# Altium schematic sheet HPF(20Hz).SchDoc
size A; SheetNumber: 5; SheetTotal: 7
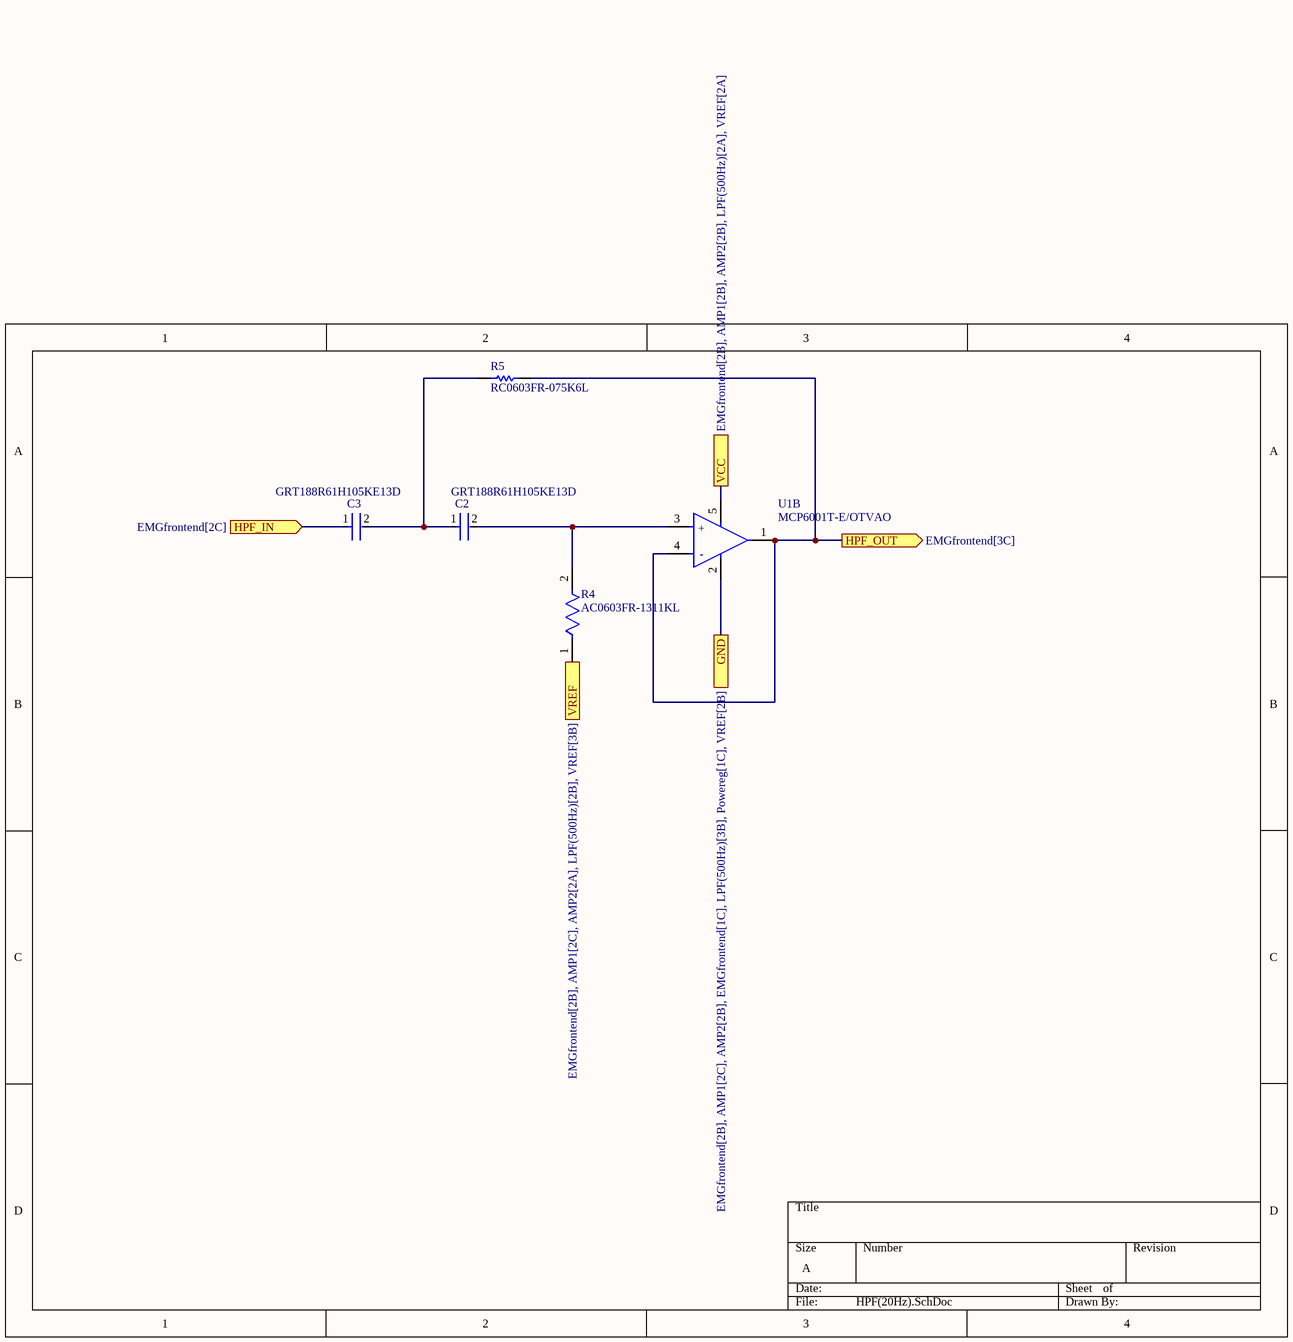
[diagram p0: HPF(20Hz).SchDoc]

## Parts
C2  GRT188R61H105KE13D  [FP-GRT188-0_1-e0_2_0_5-IPC_B]
C3  GRT188R61H105KE13D  [FP-GRT188-0_1-e0_2_0_5-IPC_B]
R4  AC0603FR-1311KL  [FP-AC0603-IPC_B]
R5  RC0603FR-075K6L  [RESC1608X55X25ML10T15]
U1B  MCP6001T-E/OTVAO  [FP-C04-091-OT-MFG]

## Ports
GND (see EMGfrontend[2B], AMP1[2C], AMP2[2B], EMGfrontend[1C], LPF(500Hz)[3B], Powereg[1C], VREF[2B]), HPF_IN (in, see EMGfrontend[2C]), HPF_OUT (out, see EMGfrontend[3C]), VCC (see EMGfrontend[2B], AMP1[2B], AMP2[2B], LPF(500Hz)[2A], VREF[2A]), VREF (in, see EMGfrontend[2B], AMP1[2C], AMP2[2A], LPF(500Hz)[2B], VREF[3B])

## Nets
GND: U1B.2(VSS) ; port GND
HPF_IN: C3.1 ; port HPF_IN
HPF_OUT: R5.2 U1B.1(VOUT) U1B.4(VIN-) ; port HPF_OUT
VCC: U1B.5(VDD) ; port VCC
VREF: R4.1 ; port VREF
NetC2_1: C2.1 C3.2 R5.1
NetC2_2: C2.2 R4.2 U1B.3(VIN+)

## Notes on the sheet
- (in symbol CMP-06302-000184-2) +; -

## Library data of the parts
C2 C3 = CMP-06035-031856-1: Multi-Layer Ceramic Capacitor 1uF 50V X5R ±10% 0603 Paper T/R; Voltage Rating (DC): 50V; Voltage Rating: 50V; Min Operating Temperature: -55°C; Case Code (Metric): 1608; Thickness: 0.035inch; Width: 0.031inch; Capacitance: 1uF; Tolerance: 10%; Max Operating Temperature: 85°C; Dielectric: X5R; Case Code (Imperial): 0603; Case/Package: 0603; Length: 0.063inch; Packaging: Tape and Reel; Mount: Surface Mount; Ratings: AEC-Q200
R4 = CMP-03412-047641-1: RES 11KΩ 1.00% 0.1W 0603; RoHS Compliant: Yes
R5 = CMP-1012-00595-2: Chip Resistor, 5.6 KOhm, +/- 1%, 0.1 W, -55 to 155 degC, 0603 (1608 Metric), RoHS, Tape and Reel; Voltage Rating: 50 V; Case\Package: 0603; Power Rating: 100 mW; Type (Resistor): Thick Film; Resistance: 332 kohm; ComponentLink1Description: Manufacturer URL; Case Code (Metric): 1608; Height: 0.45 mm; Min Operating Temperature: -55 degC; RoHSCompliant: true; ComponentLink2URL: http://www.yageo.com/documents/recent/PYu-RC_Group_51_RoHS_L_04.pdf; Length: 1.6 mm; ComponentLink2Description: Datasheet; Width: 0.8 mm; PackageReference: 0603; DatasheetVersion: Rev. 4, 02/2016; Package Quantity: 5000; Tolerance: 1%; Case Code (Imperial): 0603; PackageDescription: 2-Pin Surface Mount Device, Body 1.6 x 0.8 mm; ComponentLink1URL: http://www.yageo.com/; Max Operating Temperature: 155 degC; Packaging: Tape and Reel
U1B = CMP-06302-000184-2: None; NexarPartId: 52876797; Min Supply Voltage: 1.8V; Output Current per Channel: 23mA; Max Junction Temperature (Tj): 150°C; Input Bias Current: 1.1nA; Max Supply Voltage: 6V; Input Offset Voltage (Vos): 4.5mV; Voltage Gain: 112dB; Nominal Supply Current: 100µA; Number of Channels: 1; RoHS: Non-Compliant; Height: 1.45mm; Max Operating Temperature: 125°C; Ambient Temperature Range High: 125°C; Case/Package: SOT-23-5; Min Operating Temperature: -40°C; Lifecycle Status: Production